# Altium schematic sheet CAN.SchDoc
size A4; SheetNumber: 2; SheetTotal: 21
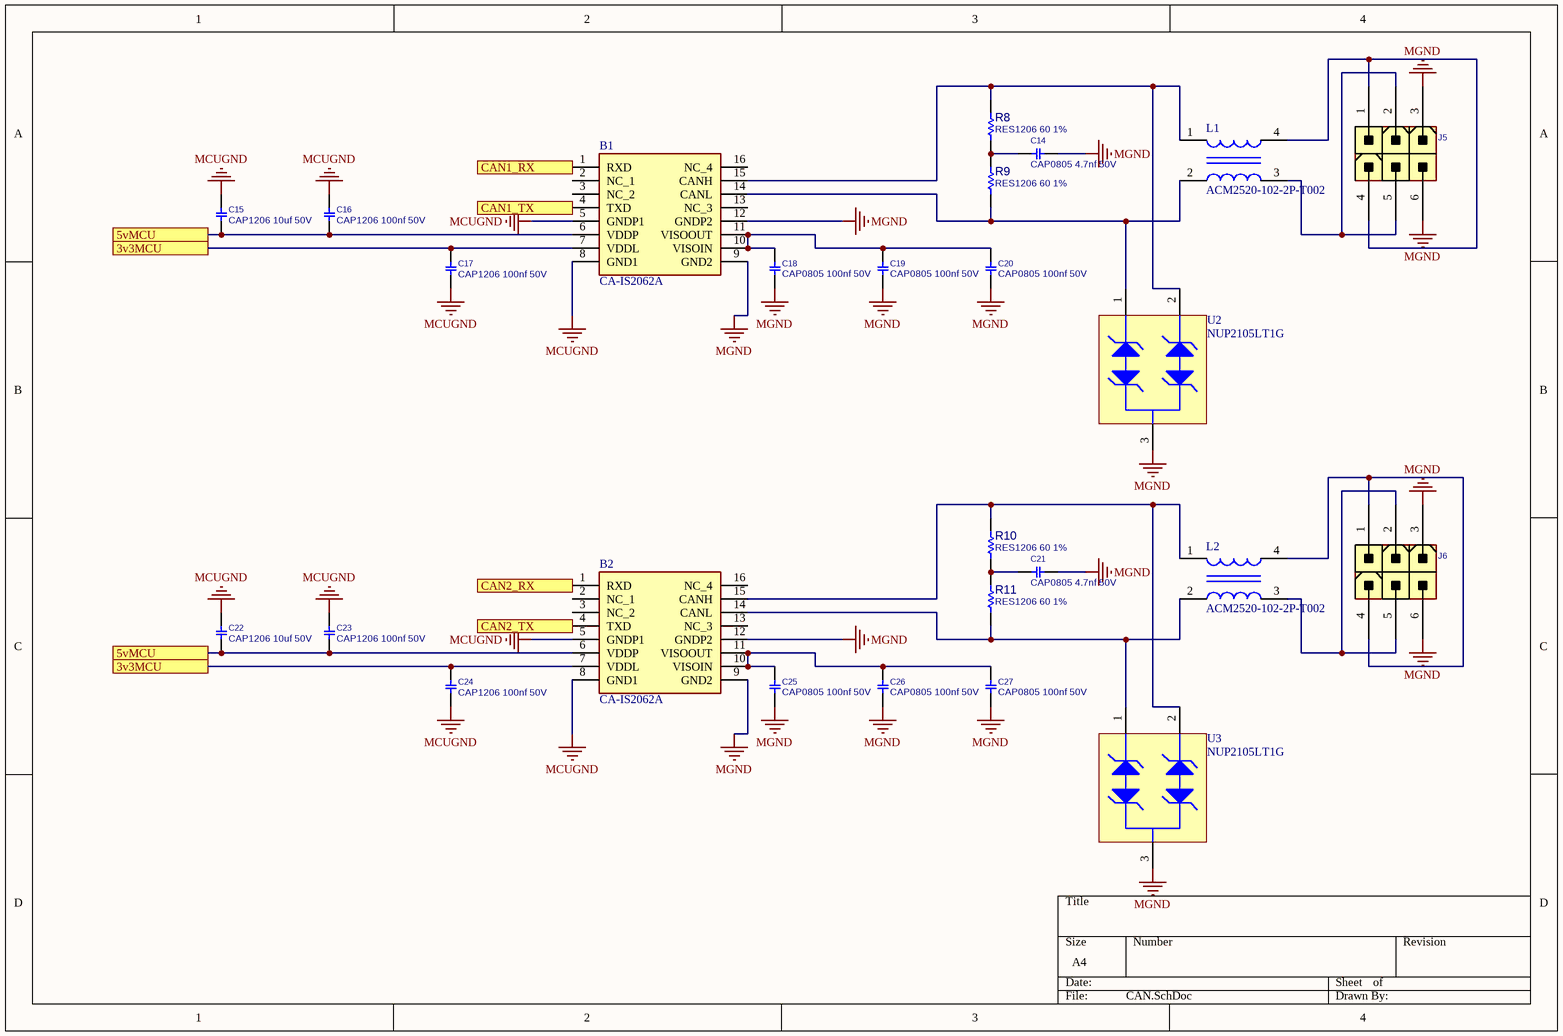
[diagram p0: CAN.SchDoc]

## Parts
B1  CA-IS2062A  [CAIS2062A]
B2  CA-IS2062A  [CAIS2062A]
C14  CAP0805 4.7nf 50V  [C0805]
C15  CAP1206 10uf 50V  [C1206]
C16  CAP1206 100nf 50V  [C1206]
C17  CAP1206 100nf 50V  [C1206]
C18  CAP0805 100nf 50V  [C0805]
C19  CAP0805 100nf 50V  [C0805]
C20  CAP0805 100nf 50V  [C0805]
C21  CAP0805 4.7nf 50V  [C0805]
C22  CAP1206 10uf 50V  [C1206]
C23  CAP1206 100nf 50V  [C1206]
C24  CAP1206 100nf 50V  [C1206]
C25  CAP0805 100nf 50V  [C0805]
C26  CAP0805 100nf 50V  [C0805]
C27  CAP0805 100nf 50V  [C0805]
J5  CONN_ATXPWR_6  [ATXPWR_6]  (value not drawn)
J6  CONN_ATXPWR_6  [ATXPWR_6]  (value not drawn)
L1  ACM2520-102-2P-T002  [FP-ACM2520-2P-MFG]
L2  ACM2520-102-2P-T002  [FP-ACM2520-2P-MFG]
R8  RES1206 60 1%  [R0805]
R9  RES1206 60 1%  [R0805]
R10  RES1206 60 1%  [R0805]
R11  RES1206 60 1%  [R0805]
U2  NUP2105LT1G  [PRKT-SOT23-3_V]
U3  NUP2105LT1G  [PRKT-SOT23-3_V]

## Ports
3v3MCU, 5vMCU, CAN1_RX, CAN1_TX, CAN2_RX, CAN2_TX

## Nets
MCUGND: B1.5(GNDP1) B1.8(GND1) B2.5(GNDP1) B2.8(GND1) C15.1 C16.1 C17.2 C22.1 C23.1 C24.2
MGND: B1.9(GND2) B1.12(GNDP2) B2.9(GND2) B2.12(GNDP2) C14.2 C18.1 C19.1 C20.1 C21.2 C25.1 C26.1 C27.1 J5.3 J5.6 J6.3 J6.6 U2.3 U3.3
3v3MCU: B1.7(VDDL) B2.7(VDDL) C17.1 C24.1 ; port 3v3MCU
5vMCU: B1.6(VDDP) B2.6(VDDP) C15.2 C16.2 C22.2 C23.2 ; port 5vMCU
CAN1_RX: B1.1(RXD) ; port CAN1_RX
CAN1_TX: B1.4(TXD) ; port CAN1_TX
CAN2_RX: B2.1(RXD) ; port CAN2_RX
CAN2_TX: B2.4(TXD) ; port CAN2_TX
NetB1_10: B1.10(VISOIN) B1.11(VISOOUT) C18.2 C19.2 C20.2
NetB1_14: B1.14(CANL) L1.2 R9.1 U2.1
NetB1_15: B1.15(CANH) L1.1 R8.2 U2.2
NetB2_10: B2.10(VISOIN) B2.11(VISOOUT) C25.2 C26.2 C27.2
NetB2_14: B2.14(CANL) L2.2 R11.1 U3.1
NetB2_15: B2.15(CANH) L2.1 R10.2 U3.2
NetC14_1: C14.1 R8.1 R9.2
NetC21_1: C21.1 R10.1 R11.2
NetJ5_1: J5.1 J5.4 L1.4
NetJ5_2: J5.2 J5.5 L1.3
NetJ6_1: J6.1 J6.4 L2.4
NetJ6_2: J6.2 J6.5 L2.3

Not connected (* = marked no-connect by the designer): B1 2(NC_1) 3(NC_2) 13(NC_3) 16(NC_4); B2 2(NC_1) 3(NC_2) 13(NC_3) 16(NC_4)

## Library data of the parts
B1 B2 = CA-IS2062A: LGA-16(4.7x5.2) Isolated CAN Transceivers (with Power) ROHS; Manufacturer_Name: ChipAnalog; Geometry.Height: 1.09mm; Manufacturer_Part_Number: CA-IS2062A; Mouser Part Number: *; Mouser Price/Stock: *; Arrow Part Number: *; Arrow Price/Stock: *; Datasheet Link: https://e.chipanalog.com/Public/Uploads/uploadfile/files/20250325/CAIS2062AdatasheetVersion1.01en20250325.pdf
C14 C18-C21 C25-C27 = CAP_SMD_MLCC_0805: CAP, MLCC; PARAM: -, -%; MANF_P#: MANF_PART#; PARAM2: -V; PRICE: 100= 1$; MANF: -; ASSEMBLY: ASSEMBLY
C15-C17 C22-C24 = CAP_SMD_MLCC_1206: CAP, MLCC; PARAM: -, -%; MANF_P#: MANF_PART#; PARAM2: -V; PRICE: 100= 1$; MANF: -; ASSEMBLY: ASSEMBLY
J5 J6 = CONN_ATXPWR_6: CONN, ATX POWER, 6 P; MANF: TE; MANF_P#: 4-1775099-1; VALUE: CONN_ATXPWR_6; MountType: THD; PACKAGE: ATXPWR-6pin; Part Type: Conn.
L1 L2 = CMP-08256-000009-1: CMC 200MA 2LN 1KOHM SMD; Number of Lines: 2; Impedance: 1kR; Test Frequency: 100MHz; DC Resistance (DCR): 900mR; Voltage Rating: 20V; Series: ACM; Lead Free: Lead Free; Height: 0.051inch; Length: 0.098inch; Max DC Current: 200mA; Depth: 2.2mm; Package Quantity: 1; Case/Package: 1008; Max Operating Temperature: 85°C; Termination: SMD/SMT; Min Operating Temperature: -40°C; Packaging: Tape and Reel; DC Current: 200mA; Current: 200mA; Mount: Surface Mount; Width: 0.079inch
R8-R11 = RES_SMD_0805: RESISTOR, SMD; PARAM: -W; DESC: DESCRIPTION; DIST#: MOUSER; MANF_P#: -; MANF: -; ASSEMBLY: ASSEMBLY; PRICE: 100= 0.5$; PARAM2: 1%
U2 U3 = CMP-2000-07553-1: TVS Array - Asymmetrical Data Line Protector, 600 W, 7.5 V, -55 to 150 degC, 3-Pin SOT23, RoHS, Tape and Reel; Manufacturer: Protek Devices; Min Breakdown Voltage: 7.5V; Direction: Bidirectional; Capacitance: 75pF; Current: 20uA; Power Dissipation: 600W; Working Voltage: 7V; Voltage: 12V; Case\/Package: SOT-23; Clamping Voltage: 17V; Element Configuration: Dual; Mounting Technology: SurfaceMount; RoHSCompliant: True; Radiation Hardening: No; Depth: 1.4mm; Lead Free: LeadFree; Package Description: 3-Pin Small Outline Transistor, Body 2.92 x 1.3 mm, Pitch 0.94 mm; Max Operating Temperature: 150degC; Length: 3.04mm; Manufacturer URL: http://www.protekdevices.com/; Min Operating Temperature: -55degC; Leakage Current: 20uA; Datasheet URL: www.protekdevices.com/xyz/documents/datasheets/psm712.pdf; Packaging: TapeandReel; Datasheet Version: 10/2013; Package Reference: SOT23-3; Number of Pins: 3